# Altium schematic sheet Quectel_EG800AK-CN_SCH_Part_AD_20250802.SchDoc
size A1
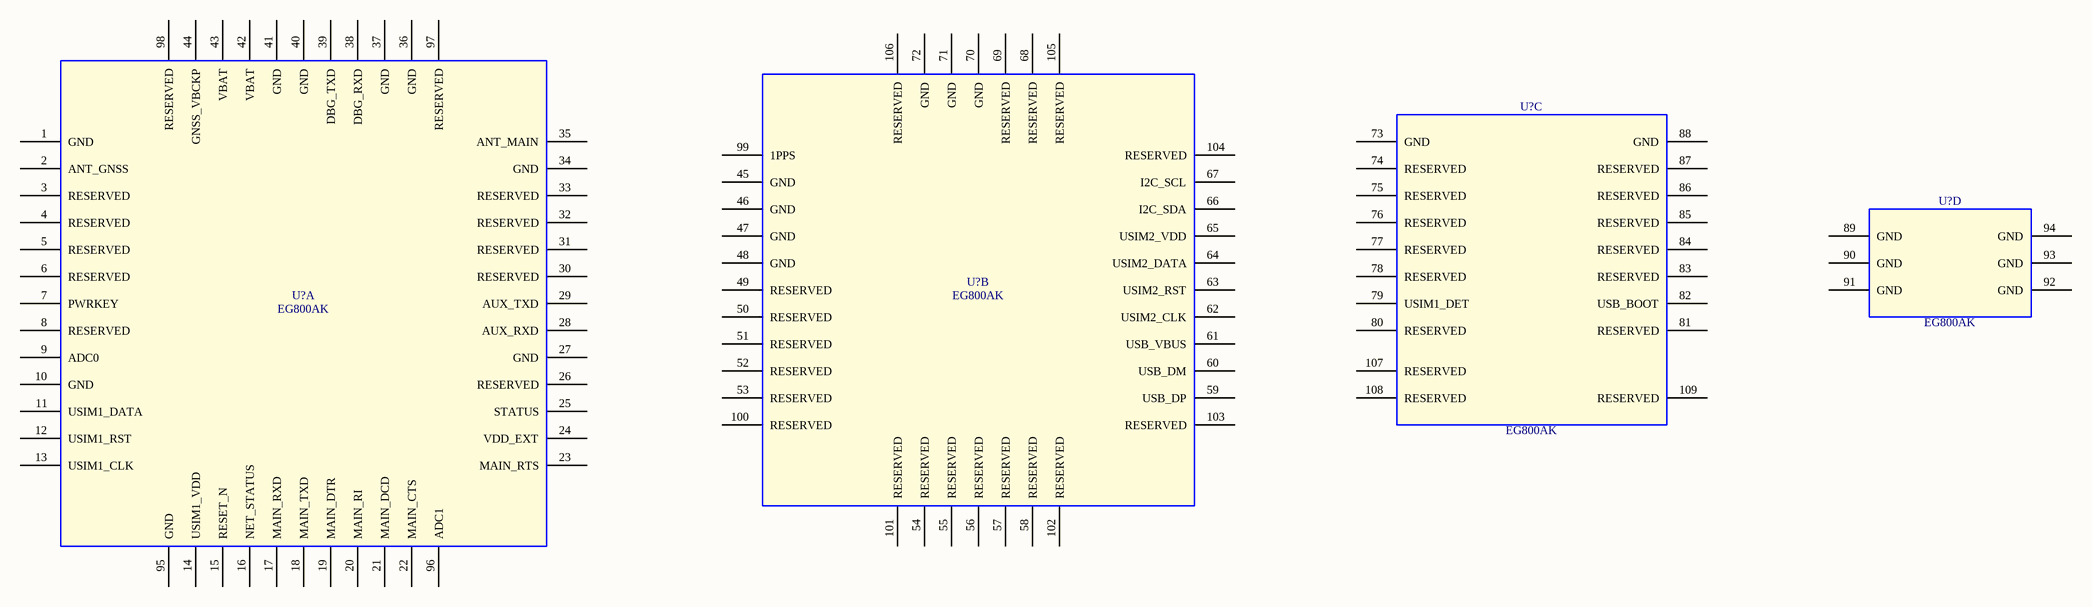
[diagram p0: Quectel_EG800AK-CN_SCH_Part_AD_20250802.SchDoc]

## Parts
(Parts that share a designator on the sheet are numbered #1, #2 ... from top to bottom, then left to right.)
U?#1  EG800AK  [EG800AK]  (part C of 4)
U?#2  EG800AK  [EG800AK]  (part D of 4)
U?#3  EG800AK  [EG800AK]  (part B of 4)
U?#4  EG800AK  [EG800AK]  (part A of 4)

## Nets

Not connected (* = marked no-connect by the designer): U?#1 73(GND) 74(RESERVED) 75(RESERVED) 76(RESERVED) 77(RESERVED) 78(RESERVED) 79(USIM1_DET) 80(RESERVED) 81(RESERVED) 82(USB_BOOT) 83(RESERVED) 84(RESERVED) 85(RESERVED) 86(RESERVED) 87(RESERVED) 88(GND) 107(RESERVED) 108(RESERVED) 109(RESERVED); U?#2 89(GND) 90(GND) 91(GND) 92(GND) 93(GND) 94(GND); U?#3 45(GND) 46(GND) 47(GND) 48(GND) 49(RESERVED) 50(RESERVED) 51(RESERVED) 52(RESERVED) 53(RESERVED) 54(RESERVED) 55(RESERVED) 56(RESERVED) 57(RESERVED) 58(RESERVED) 59(USB_DP) 60(USB_DM) 61(USB_VBUS) 62(USIM2_CLK) 63(USIM2_RST) 64(USIM2_DATA) 65(USIM2_VDD) 66(I2C_SDA) 67(I2C_SCL) 68(RESERVED) 69(RESERVED) 70(GND) 71(GND) 72(GND) 99(1PPS) 100(RESERVED) 101(RESERVED) 102(RESERVED) 103(RESERVED) 104(RESERVED) 105(RESERVED) 106(RESERVED); U?#4 1(GND) 2(ANT_GNSS) 3(RESERVED) 4(RESERVED) 5(RESERVED) 6(RESERVED) 7(PWRKEY) 8(RESERVED) 9(ADC0) 10(GND) 11(USIM1_DATA) 12(USIM1_RST) 13(USIM1_CLK) 14(USIM1_VDD) 15(RESET_N) 16(NET_STATUS) 17(MAIN_RXD) 18(MAIN_TXD) 19(MAIN_DTR) 20(MAIN_RI) 21(MAIN_DCD) 22(MAIN_CTS) 23(MAIN_RTS) 24(VDD_EXT) 25(STATUS) 26(RESERVED) 27(GND) 28(AUX_RXD) 29(AUX_TXD) 30(RESERVED) 31(RESERVED) 32(RESERVED) 33(RESERVED) 34(GND) 35(ANT_MAIN) 36(GND) 37(GND) 38(DBG_RXD) 39(DBG_TXD) 40(GND) 41(GND) 42(VBAT) 43(VBAT) 44(GNSS_VBCKP) 95(GND) 96(ADC1) 97(RESERVED) 98(RESERVED)

## Library data of the parts
U?#1-U?#4 = EG800AK: EG800AK-CN Module 109PIN 17.7X15.8mm H2.4mm RO; Manufacturer: QUECTEL; Geometry.Height: 2.4mm; Part Description: EG800AK-CN Module 109PIN 17.7X15.8mm H2.4mm RO; Value: EG800AK